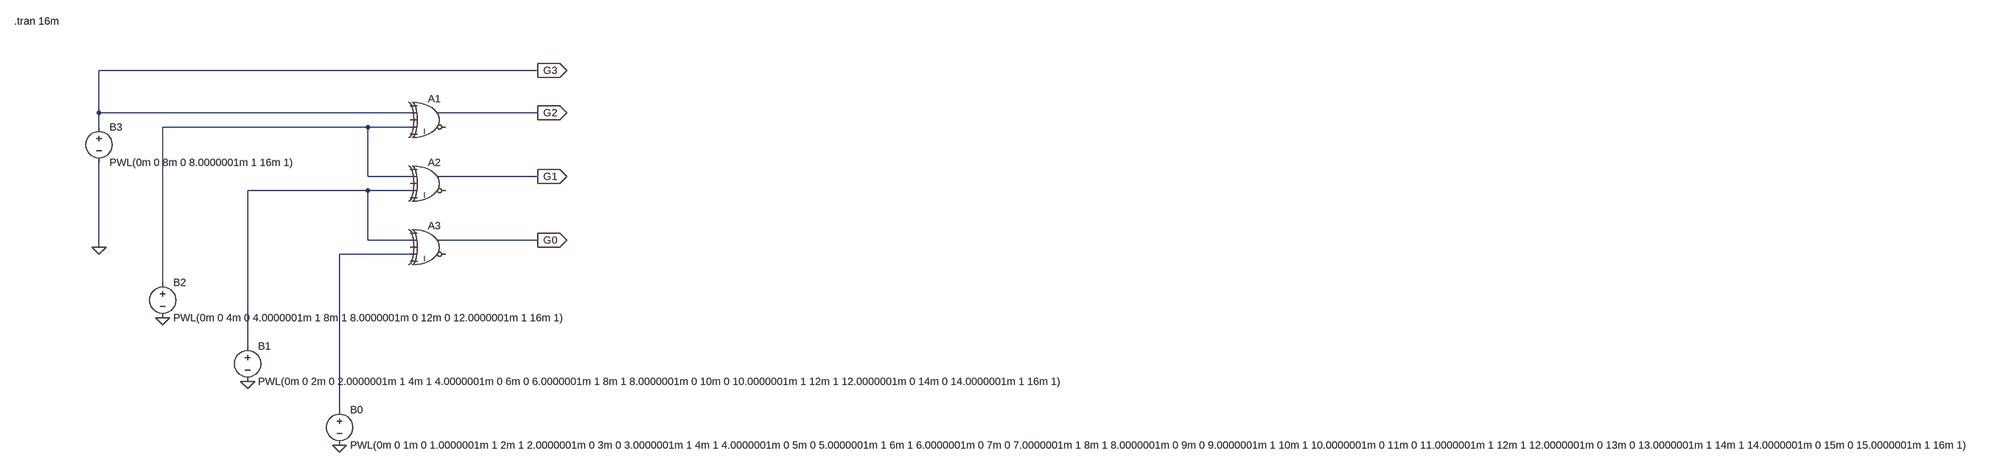
[diagram p0: schematic p41.asc]
p41.asc, the LTspice schematic file:
Version 4.1
SHEET 1 3620 680
WIRE 64 -240 -928 -240
WIRE -928 -144 -928 -240
WIRE -224 -144 -928 -144
WIRE 64 -144 -160 -144
WIRE -928 -112 -928 -144
WIRE -320 -112 -784 -112
WIRE -224 -112 -320 -112
WIRE -320 0 -320 -112
WIRE -224 0 -320 0
WIRE 64 0 -160 0
WIRE -320 32 -592 32
WIRE -224 32 -320 32
WIRE -320 144 -320 32
WIRE -224 144 -320 144
WIRE 64 144 -160 144
WIRE -928 160 -928 -32
WIRE -224 176 -384 176
WIRE -784 240 -784 -112
WIRE -592 384 -592 32
WIRE -384 528 -384 176
FLAG -928 160 0
FLAG -784 320 0
FLAG -592 464 0
FLAG -384 608 0
FLAG 64 -240 G3
IOPIN 64 -240 Out
FLAG 64 -144 G2
IOPIN 64 -144 Out
FLAG 64 0 G1
IOPIN 64 0 Out
FLAG 64 144 G0
IOPIN 64 144 Out
SYMBOL voltage -928 -128 R0
WINDOW 123 0 0 Left 0
WINDOW 39 0 0 Left 0
SYMATTR InstName B3
SYMATTR Value PWL(0m 0 8m 0 8.0000001m 1 16m 1)
SYMBOL voltage -784 224 R0
WINDOW 123 0 0 Left 0
WINDOW 39 0 0 Left 0
SYMATTR InstName B2
SYMATTR Value PWL(0m 0 4m 0 4.0000001m 1 8m 1 8.0000001m 0 12m 0 12.0000001m 1 16m 1)
SYMBOL voltage -592 368 R0
WINDOW 123 0 0 Left 0
WINDOW 39 0 0 Left 0
SYMATTR InstName B1
SYMATTR Value PWL(0m 0 2m 0 2.0000001m 1 4m 1 4.0000001m 0 6m 0 6.0000001m 1 8m 1 8.0000001m 0 10m 0 10.0000001m 1 12m 1 12.0000001m 0 14m 0 14.0000001m 1 16m 1)
SYMBOL voltage -384 512 R0
WINDOW 123 0 0 Left 0
WINDOW 39 0 0 Left 0
SYMATTR InstName B0
SYMATTR Value PWL(0m 0 1m 0 1.0000001m 1 2m 1 2.0000001m 0 3m 0 3.0000001m 1 4m 1 4.0000001m 0 5m 0 5.0000001m 1 6m 1 6.0000001m 0 7m 0 7.0000001m 1 8m 1 8.0000001m 0 9m 0 9.0000001m 1 10m 1 10.0000001m 0 11m 0 11.0000001m 1 12m 1 12.0000001m 0 13m 0 13.0000001m 1 14m 1 14.0000001m 0 15m 0 15.0000001m 1 16m 1)
SYMBOL Digital\\xor -176 -192 R0
SYMATTR InstName A1
SYMBOL Digital\\xor -176 -48 R0
SYMATTR InstName A2
SYMBOL Digital\\xor -176 96 R0
SYMATTR InstName A3
TEXT -1120 -352 Left 2 !.tran 16m

The netlist it stands for:
* p41.asc
V§B3 G3 0 PWL(0m 0 8m 0 8.0000001m 1 16m 1)
V§B2 N001 0 PWL(0m 0 4m 0 4.0000001m 1 8m 1 8.0000001m 0 12m 0 12.0000001m 1 16m 1)
V§B1 N002 0 PWL(0m 0 2m 0 2.0000001m 1 4m 1 4.0000001m 0 6m 0 6.0000001m 1 8m 1 8.0000001m 0 10m 0 10.0000001m 1 12m 1 12.0000001m 0 14m 0 14.0000001m 1 16m 1)
V§B0 N003 0 PWL(0m 0 1m 0 1.0000001m 1 2m 1 2.0000001m 0 3m 0 3.0000001m 1 4m 1 4.0000001m 0 5m 0 5.0000001m 1 6m 1 6.0000001m 0 7m 0 7.0000001m 1 8m 1 8.0000001m 0 9m 0 9.0000001m 1 10m 1 10.0000001m 0 11m 0 11.0000001m 1 12m 1 12.0000001m 0 13m 0 13.0000001m 1 14m 1 14.0000001m 0 15m 0 15.0000001m 1 16m 1)
A1 0 G3 0 N001 0 0 G2 0 XOR
A2 0 N001 0 N002 0 0 G1 0 XOR
A3 0 N002 0 N003 0 0 G0 0 XOR
.tran 16m
.backanno
.end